# Altium schematic sheet 0-24mA-Input-Sheet.SchDoc
size A4; SheetNumber: 9; SheetTotal: 11
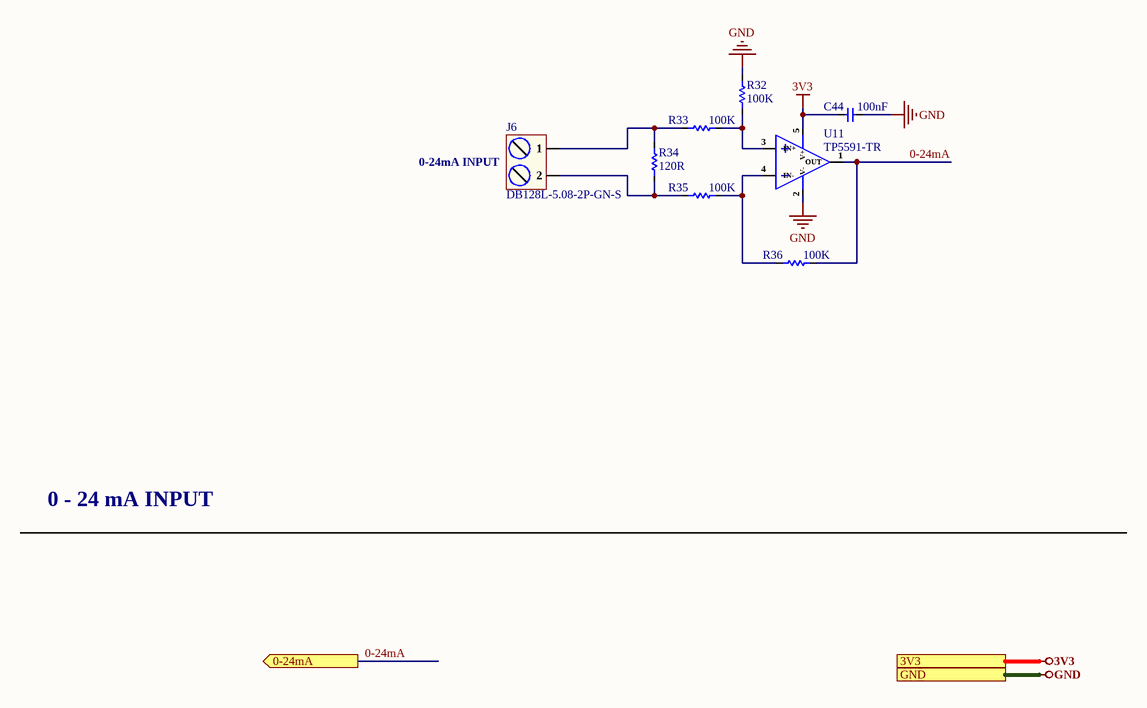
[diagram p0: 0-24mA-Input-Sheet.SchDoc]

## Parts
C44  100nF  [Cap-0603]
J6  DB128L-5.08-2P-GN-S  [DB128L-5.08-2P-GN-S]
R32  100K  [Res-0603]
R33  100K  [Res-0603]
R34  120R  [Res-0603]
R35  100K  [Res-0603]
R36  100K  [Res-0603]
U11  TP5591-TR  [SOT-23-5]

## Ports
0-24mA (out, see Top-Sheet[3B], Controller-Sheet[3D]), 3V3 (see Top-Sheet[4A], 01M21V00-Sensor-Sheet[3D], 20x4-Display-Sheet[3D], Connectors-SW-LEDs-Sheet[3D], Controller-Sheet[3D], Optical-Encoder-Sheet[3D], Power-Sheet[3D], Stepper-Driver-Sheet[3D]), GND (see Top-Sheet[4A], 01M21V00-Sensor-Sheet[3D], 20x4-Display-Sheet[3D], Buzzer-Sheet[3D], Connectors-SW-LEDs-Sheet[3D], Controller-Sheet[3D], Optical-Encoder-Sheet[3D], Power-Sheet[3D], Relay-Sheet[3D], Stepper-Driver-Sheet[3D])

## Nets
3V3: C44.2 U11.5(V+) ; port 3V3
GND: C44.1 R32.2 U11.2(V-) ; port GND
0-24mA: R36.2 U11.1(OUT) ; port 0-24mA
NetJ6_1: J6.1 R33.1 R34.2
NetJ6_2: J6.2 R34.1 R35.1
NetR32_1: R32.1 R33.2 U11.3(IN+)
NetR35_2: R35.2 R36.1 U11.4(IN-)

## Notes on the sheet
- 0-24mA INPUT
- 0 - 24 mA INPUT
- File:
- Title:
- Date:
- Page
- Num:
- Total:
- Drawn By: Huzaifa Ali

## Library data of the parts
C44 = CC0603KRX5R9BB104: CAP CER 0.1UF 50V X5R 0603; Manufacturer: Yageo; Tolerance: 10%; Item Type: Capacitor; Supplier 1: Digi-Key; Manufacturer Part Number: CC0603KRX5R9BB104; RoHS: Yes; Category: Ceramic Capacitors; Stock 1: 152253; Pricing 1: 1=0.10000, 10=0.05200, 50=0.02820, 100=0.02310, 500=0.01648, 1000=0.01294 (USD); Mount: Surface Mount; Case/Package: 0603; Case Code (Imperial): 0603; Case Code (Metric): 1608; Weight: 7.1E-05oz; Min Operating Temperature: -55°C; Max Operating Temperature: 85°C; Capacitance: 100nF; Packaging: Tape and Reel; Voltage Rating: 50V; Dielectric: X5R; Termination: SMD/SMT; Voltage Rating (DC): 50V; Package Quantity: 4000; Length: 0.063inch; Width: 0.031inch; Thickness: 0.035inch; Lead Free: Lead Free; Halogen Free: Halogen Free; ComponentLink1URL: http://www.mouser.com/ds/2/447/Yageo_UPY-GP_NP0_16V-to-50V_9-358835.pdf?src-supplier=Mouser; ComponentLink1Description: http://www.mouser.com/ds/2/447/Yageo_UPY-GP_NP0_16V-to-50V_9-358835.pdf?src-supplier=Mouser; ComponentLink2URL: https://www.yageo.com/upload/media/product/productsearch/datasheet/mlcc/UPY-GPHC_X5R_4V-to-50V_26.pdf?src-supplier=Digi-Key; ComponentLink2Description: https://www.yageo.com/upload/media/product/productsearch/datasheet/mlcc/UPY-GPHC_X5R_4V-to-50V_26.pdf?src-supplier=Digi-Key; ComponentLink3URL: http://www.yageo.com/exep/pages/download/literatures/ProductSelectionGuide%202014_Final_2.pdf?src-supplier=Digi-Key; ComponentLink3Description: http://www.yageo.com/exep/pages/download/literatures/ProductSelectionGuide%202014_Final_2.pdf?src-supplier=Digi-Key; Supplier Part Number 1: 311-4046-1-ND; LCSC Part Number: C110022
J6 = DB128L-5.08-2P-GN-S: 1x2P 18A -40℃~+105℃ 250V Green 12~30 Straight 5.08mm 2.5 1 2 Plugin,P=5.08mm Screw terminal ROHS; Manufacturer: DORABO; Item Type: Terminal Block; Manufacturer Part Number: DB128L-5.08-2P-GN-S; Package: Plugin,P=5.08mm; LCSC Part Number: C395868; ComponentLink1Description: LCSC; ComponentLink1URL: https://www.lcsc.com/product-detail/Screw-terminal_DORABO-DB128L-5-08-2P-GN-S_C395868.html
R32 R33 R35 R36 = RT0603BRD07100KL: RES SMD 100K OHM 0.1% 1/10W 0603; Manufacturer: Yageo; Resistance: 100kR; Temperature Coefficient: 25ppm/°C; Voltage Rating (DC): 75V; Power Rating: 100mW; Item Type: Resistor; Supplier 1: Digi-Key; Manufacturer Part Number: RT0603BRD07100KL; Stock 1: 53395; Pricing 1: 1=0.39, 10=0.332, 100=0.1298, 1000=0.05435, 2500=0.04982 (USD); Mount: Surface Mount; Case/Package: 0603; Case Code (Imperial): 0603; Case Code (Metric): 1608; Min Operating Temperature: -55°C; Max Operating Temperature: 125°C; Tolerance: 0.1%; Composition: Thin Film; Packaging: Tape and Reel; Voltage Rating: 75V; Package Quantity: 5000; Termination: SMD/SMT; Number of Terminations: 2; Military Standard: Not; Max Power Dissipation: 100mW; Working Voltage: 75V; Features: Moisture Resistant; Length: 1.6mm; Height: 0.022inch; Width: 0.031inch; Depth: 0.8mm; Lead Free: Lead Free; ComponentLink1URL: http://documents.rs-components.com/techlib://itc_doclist_GB.htm?stockno=6174810&src-supplier=RSComponents; ComponentLink1Description: http://documents.rs-components.com/techlib://itc_doclist_GB.htm?stockno=6174810&src-supplier=RSComponents; Supplier Part Number 1: YAG1235CT-ND; LCSC Part Number: C122538
R34 = RT0603BRB07120RL: RES SMD 120 OHM 0.1% 1/10W 0603; Manufacturer: Yageo; Max Power Dissipation: 100mW; Temperature Coefficient: 10ppm/°C; Voltage Rating: 75V; Item Type: Resistor; Supplier: Digikey; Supplier Part Number: RT0603BRB07120RL-ND; Manufacturer Part Number: RT0603BRB07120RL; RoHS: Yes; Category: Chip SMD Resistors; Pricing: 5000=0.13797 (USD); Case/Package: 0603; Min Operating Temperature: -55°C; Max Operating Temperature: 155°C; Packaging: Tape and Reel; Value: 120R; Number of Terminations: 2; Tolerance: 0.1%; Features: Moisture Resistant; Series: RT; Length: 0.063inch; Width: 0.031inch; Height: 0.022inch; RoHS Compliant: Yes; ComponentLink1URL: http://www.yageo.com/documents/recent/PYu-RT_1-to-0.01_RoHS_L_8.pdf?src-supplier=Digikey; ComponentLink1Description: http://www.yageo.com/documents/recent/PYu-RT_1-to-0.01_RoHS_L_8.pdf?src-supplier=Digikey; LCSC Part Number: C860088
U11 = TP5591-TR: SOT-23-5 Precision OpAmps ROHS; Manufacturer: 3PEAK; Item Type: OpAmp; Manufacturer Part Number: TP5591-TR; Package: SOT-23-5; LCSC Part Number: C248602; ComponentLink1Description: LCSC; ComponentLink1URL: https://www.lcsc.com/product-detail/Precision-OpAmps_3PEAK-TP5591-TR_C248602.html